# Altium schematic sheet BLE_Module_Sheet.SchDoc
size A4; SheetNumber: 3; SheetTotal: 4
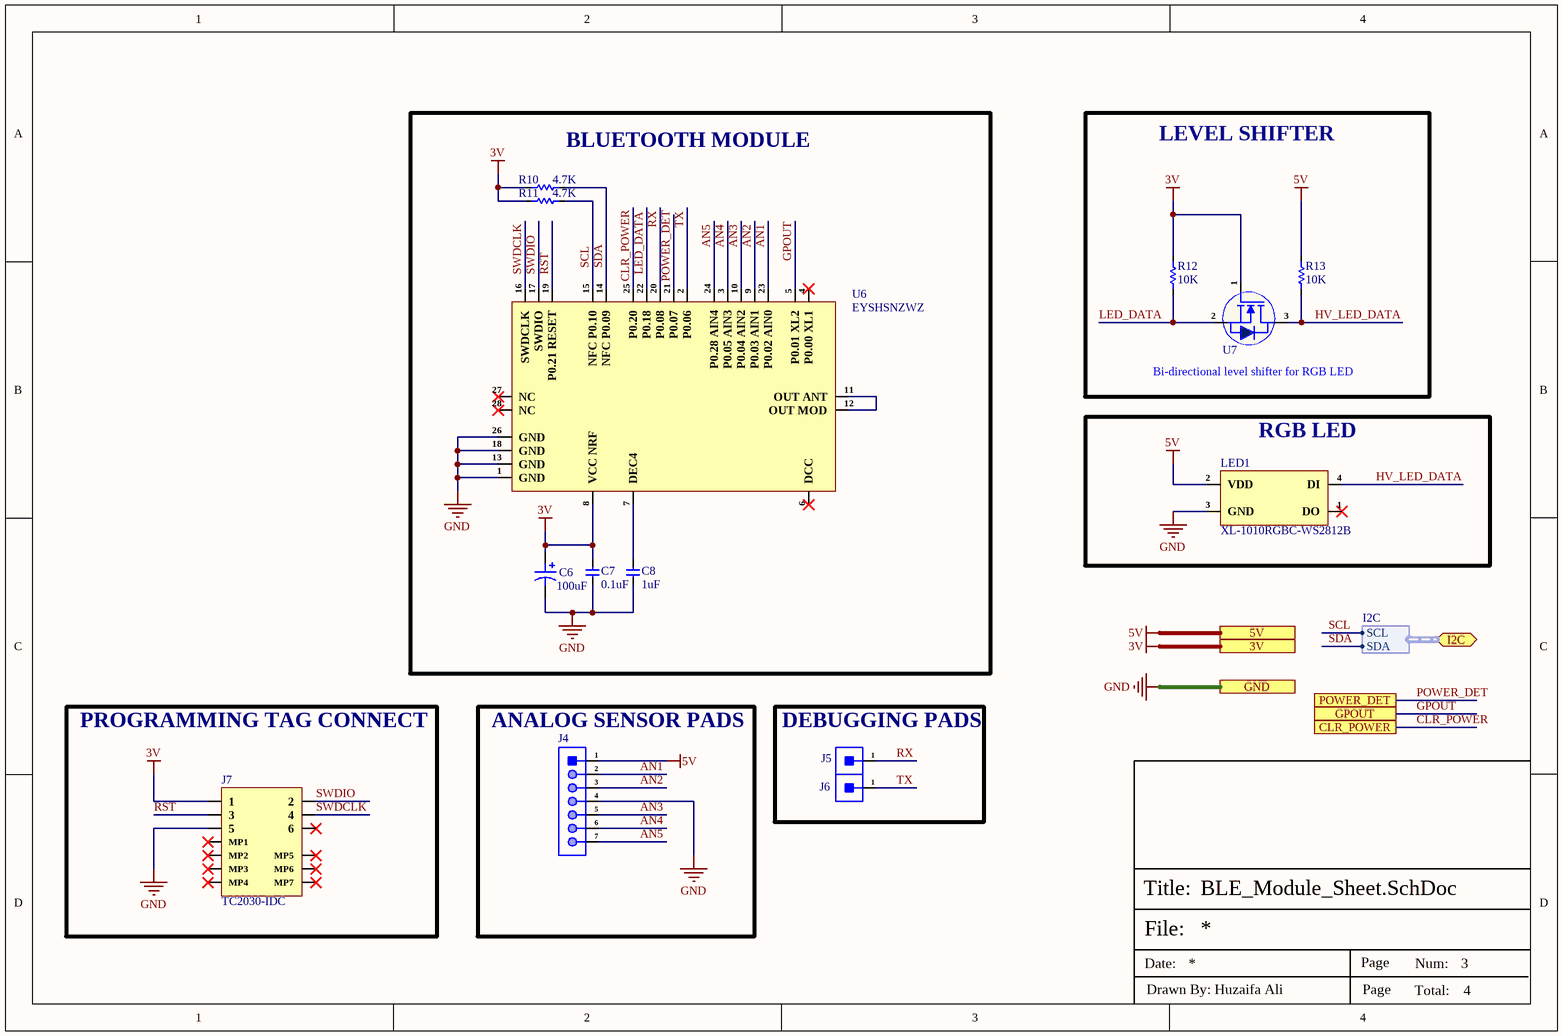
[diagram p0: BLE_Module_Sheet.SchDoc]

## Parts
C6  100uF  [F980J107MMAAXE]
C7  0.1uF  [CAP-0201]
C8  1uF  [CAP-0201]
J4  Sensor Pads 0.5mm Dia  [Sensor-Pads 0.5mm Dia]  (value not drawn)
J5  1 Sensor Pad 0.5mm  [1 Sensor Pad 0.5mm]  (value not drawn)
J6  1 Sensor Pad 0.5mm  [1 Sensor Pad 0.5mm]  (value not drawn)
J7  TC2030-IDC  [TC2030-IDC_]
LED1  XL-1010RGBC-WS2812B  [XL-1010RGBC-WS2812B]
R10  4.7K  [Res-0201]
R11  4.7K  [Res-0201]
R12  10K  [Res-0201]
R13  10K  [Res-0201]
U6  EYSHSNZWZ  [EYSHSNZWZ]
U7  NTNS3193NZT5G  [X-LLGA-3]  (value not drawn)

## Blocks framed on the sheet
BLUETOOTH MODULE: C6-C8 R10 R11 U6
LEVEL SHIFTER: R12 R13 U7
RGB LED: LED1
PROGRAMMING TAG CONNECT: J7
ANALOG SENSOR PADS: J4
DEBUGGING PADS: J5 J6

## Ports
3V, 5V, CLR_POWER, GND, GPOUT, I2C (bidir, harness I2C), POWER_DET

## Harnesses
I2C: SDA, SCL

## Nets
3V: C6.1 C7.2 J7.1 R10.2 R11.2 R12.2 U6.8(VCC_NRF) U7.1(G) ; port 3V
5V: J4.1 LED1.2(VDD) R13.2 ; port 5V
GND: C6.2 C7.1 C8.1 J4.4 J7.5 LED1.3(GND) U6.1(GND) U6.13(GND) U6.18(GND) U6.26(GND) ; port GND
AN1: J4.2 U6.23(P0.02_AIN0)
AN2: J4.3 U6.9(P0.03_AIN1)
AN3: J4.5 U6.10(P0.04_AIN2)
AN4: J4.6 U6.3(P0.05_AIN3)
AN5: J4.7 U6.24(P0.28_AIN4)
CLR_POWER: U6.25(P0.20) ; port CLR_POWER
GPOUT: U6.5(P0.01_XL2) ; port GPOUT
HV_LED_DATA: LED1.4(DI) R13.1 U7.3(D)
LED_DATA: R12.1 U6.22(P0.18) U7.2(S)
POWER_DET: U6.21(P0.07) ; port POWER_DET
RST: J7.3 U6.19(P0.21_RESET)
RX: J5.1 U6.20(P0.08)
SCL: R11.1 U6.15(NFC_P0.10) ; port I2C.SCL
SDA: R10.1 U6.14(NFC_P0.09) ; port I2C.SDA
SWDCLK: J7.4 U6.16(SWDCLK)
SWDIO: J7.2 U6.17(SWDIO)
TX: J6.1 U6.2(P0.06)
NetC8_2: C8.2 U6.7(DEC4)
NetU6_11: U6.11(OUT_ANT) U6.12(OUT_MOD)

Not connected (* = marked no-connect by the designer): J7 6* MP1* MP2* MP3* MP4* MP5* MP6* MP7*; LED1 1(DO)*; U6 4(P0.00_XL1)* 6(DCC)* 27(NC)* 28(NC)*

## Notes on the sheet
- (near U7) Bi-directional level shifter for RGB LED
- File:
- Title:
- Date:
- Page
- Num:
- Total:
- Drawn By: Huzaifa Ali

## Library data of the parts
C6 = F980J107MMAAXE: CAP TANT 100UF 20% 6.3V 0603; Manufacturer: Kyocera AVX; Item Type: Capacitor; Supplier: Digi-Key; Supplier Part Number: 478-9836-1-ND; Manufacturer Part Number: F980J107MMAAXE; RoHS: Yes; Category: Tantalum Capacitors; Stock: 133089; Pricing: 1=0.71, 10=0.505, 50=0.382, 100=0.3327, 500=0.24644, 1000=0.20947 (USD); ComponentLink1URL: http://www.farnell.com/datasheets/2602422.pdf?src-supplier=Farnell; ComponentLink1Description: http://www.farnell.com/datasheets/2602422.pdf?src-supplier=Farnell; ComponentLink2URL: https://datasheet.octopart.com/F980J107MMAAXE-AVX-datasheet-104407997.pdf?src-supplier=Newark; ComponentLink2Description: https://datasheet.octopart.com/F980J107MMAAXE-AVX-datasheet-104407997.pdf?src-supplier=Newark; ComponentLink3URL: https://datasheet.octopart.com/F980J107MMAAXE-KYOCERA-AVX-datasheet-57254939.pdf?src-supplier=Future+Electronics; ComponentLink3Description: https://datasheet.octopart.com/F980J107MMAAXE-KYOCERA-AVX-datasheet-57254939.pdf?src-supplier=Future+Electronics; ComponentLink4URL: http://datasheets.avx.com/F98.pdf?src-supplier=Digi-Key; ComponentLink4Description: http://datasheets.avx.com/F98.pdf?src-supplier=Digi-Key; ComponentLink5URL: http://www.farnell.com/datasheets/2649022.pdf?src-supplier=Newark; ComponentLink5Description: http://www.farnell.com/datasheets/2649022.pdf?src-supplier=Newark; LCSC Part Number: C1955164
C7 = CC0201KRX5R6BB104: CAP CER 0.1UF 10V X5R 0201; Manufacturer: Yageo; Capacitance: 100nF; Tolerance: 10%; Supplier 1: Mouser; Manufacturer Part Number: CC0201KRX5R6BB104; RoHS: Yes; Category: Ceramic Capacitors; Stock 1: 824403; Pricing 1: 1=0.10000, 10=0.02400, 50=0.02400, 100=0.01900, 1000=0.01100, 10000=0.00900 (USD); Mount: Surface Mount; Case/Package: 0201; Case Code (Imperial): 0201; Case Code (Metric): 0603; Weight: 6E-06oz; Min Operating Temperature: -55°C; Max Operating Temperature: 85°C; Dielectric: X5R; Voltage Rating (DC): 10V; Packaging: Tape and Reel; Termination: SMD/SMT; Resistor Type: Ceramic; Voltage Rating: 10V; Series: CC; Construction: Flat; Length: 0.6mm; Width: 0.012inch; Height: 0.3mm; Thickness: 0.013inch; Depth: 0.3mm; Radiation Hardening: No; Lead Free: Lead Free; Halogen Free: Halogen Free; RoHS Compliant: Yes; ComponentLink1URL: https://datasheet.ciiva.com/11587/upy-gphc-x5r-4v-to-50v-12-11587190.pdf?src-supplier=Avnet; ComponentLink1Description: https://datasheet.ciiva.com/11587/upy-gphc-x5r-4v-to-50v-12-11587190.pdf?src-supplier=Avnet; Supplier Part Number 1: 603-CC201KRX5R6BB104; LCSC Part Number: C190183
C8 = CC0201MRX5R7BB105: CAP CER 1UF 16V X5R 0201; Manufacturer: Yageo; Item Type: Capacitor; Supplier: Digi-Key; Supplier Part Number: 13-CC0201MRX5R7BB105TR-ND; Manufacturer Part Number: CC0201MRX5R7BB105; RoHS: Yes; Category: Ceramic Capacitors; LCSC Part Number: C5182464
J4 = Sensor Pads 0.5mm Dia: Wire Connecting Pad; Item Type: SMD Pads; Manufacturer Part Number: Sensor Pads
J5 J6 = 1 Sensor Pad 0.5mm: Wire Connecting Pad 0.5mm; Item Type: SMD Pad; Manufacturer Part Number: 1 Sensor Pad 0.5mm
J7 = TC2030-IDC: CABLE ADAPTER 6 POS; Manufacturer: Tag-Connect; ComponentLink1URL: http://www.tag-connect.com/Materials/TC2030-MCP%20Datasheet.pdf?src-supplier=Digi-Key; ComponentLink1Description: http://www.tag-connect.com/Materials/TC2030-MCP%20Datasheet.pdf?src-supplier=Digi-Key; Supplier 1: Digi-Key; Manufacturer Part Number: TC2030-IDC; Stock 1: 284; Pricing 1: 1=43.71 (USD); Package Quantity: 1; Supplier Part Number 1: TC2030-IDC-ND
LED1 = XL-1010RGBC-WS2812B: Colorless transparence -40℃~+150℃ 正贴 RGB 120° 1010 Light Emitting Diodes (LED) ROHS; Manufacturer: XINGLIGHT; Item Type: RGB LED; Manufacturer Part Number: XL-1010RGBC-WS2812B; Package: 1010; LCSC Part Number: C5349953; ComponentLink1Description: LCSC; ComponentLink1URL: https://www.lcsc.com/product-detail/Light-Emitting-Diodes-LED_XINGLIGHT-XL-1010RGBC-WS2812B_C5349953.html
R10 R11 = RC0201FR-074K7L: RES 4.7K OHM 1% 1/20W 0201; Manufacturer: Yageo; Item Type: Resistor; Supplier: Future Electronics; Supplier Part Number: 7537285; Manufacturer Part Number: RC0201FR-074K7L; RoHS: Yes; Category: Chip SMD Resistors; Stock: 1610000; Pricing: 10000=0.0014, 50000=0.0013, 250000=0.0013, 750000=0.0012, 2000000=0.0011 (USD); ComponentLink1URL: https://datasheet.ciiva.com/2493/pyu-r-int-thick-7-2493811.pdf?src-supplier=Digi-Key; ComponentLink1Description: https://datasheet.ciiva.com/2493/pyu-r-int-thick-7-2493811.pdf?src-supplier=Digi-Key; ComponentLink2URL: https://datasheet.ciiva.com/2493/pyu-r-int-thick-7-2493812.pdf?src-supplier=Digi-Key; ComponentLink2Description: https://datasheet.ciiva.com/2493/pyu-r-int-thick-7-2493812.pdf?src-supplier=Digi-Key; ComponentLink3URL: https://datasheet.ciiva.com/2493/pyu-r-int-thick-7-2493813.pdf?src-supplier=Digi-Key; ComponentLink3Description: https://datasheet.ciiva.com/2493/pyu-r-int-thick-7-2493813.pdf?src-supplier=Digi-Key; ComponentLink4URL: https://datasheet.ciiva.com/8892/pyu-rc0201-51-rohs-l-8-8892942.pdf?src-supplier=Avnet; ComponentLink4Description: https://datasheet.ciiva.com/8892/pyu-rc0201-51-rohs-l-8-8892942.pdf?src-supplier=Avnet; ComponentLink5URL: https://datasheet.ciiva.com/7672/1563626-7672233.pdf?src-supplier=Element14; ComponentLink5Description: https://datasheet.ciiva.com/7672/1563626-7672233.pdf?src-supplier=Element14; LCSC Part Number: C138135
R12 R13 = RC0201JR-0710KL: RES SMD 10K OHM 5% 1/20W 0201; Manufacturer: Yageo; Voltage Rating (DC): 25V; Power Rating: 50mW; Resistance: 10kR; Temperature Coefficient: 200ppm/°C; Case Code (Imperial): 0201; Case Code (Metric): 0603; Case/Package: 0201; Category: Chip SMD Resistors; Contact Plating: Tin,Matte; Depth: 0.3mm; Lead Free: Lead Free; Length: 0.6mm; Manufacturer Part Number: RC0201JR-0710KL; Max Operating Temperature: 125°C; Military Standard: Not; Min Operating Temperature: -55°C; Packaging: Tape and Reel; Radiation Hardening: No; REACH SVHC: Unknown; Resistor Type: Thick Film; Termination: SMD/SMT; Tolerance: 5%; Voltage Rating: 25V; ComponentLink1Description: New link; ComponentLink1URL: *; Supplier 1: Digi-Key; RoHS: Yes; Stock 1: 1488597; Pricing 1: 1=0.10000, 10=0.02600, 100=0.01050, 1000=0.00472, 2500=0.00410, 5000=0.00338 (USD); ComponentLink2URL: https://datasheet.ciiva.com/8891/pyu-rc0201-51-rohs-l-8-8891388.pdf?src-supplier=Avnet; ComponentLink2Description: https://datasheet.ciiva.com/8891/pyu-rc0201-51-rohs-l-8-8891388.pdf?src-supplier=Avnet; ComponentLink3URL: https://datasheet.ciiva.com/7672/1563626-7672253.pdf?src-supplier=Element14; ComponentLink3Description: https://datasheet.ciiva.com/7672/1563626-7672253.pdf?src-supplier=Element14; ComponentLink4URL: https://datasheet.ciiva.com/28405/pyu-rc0201-51-rohs-l-8-28405613.pdf?src-supplier=Avnet+Europe; ComponentLink4Description: https://datasheet.ciiva.com/28405/pyu-rc0201-51-rohs-l-8-28405613.pdf?src-supplier=Avnet+Europe; ComponentLink5URL: https://datasheet.ciiva.com/7672/1563626-7672254.pdf?src-supplier=Element14; ComponentLink5Description: https://datasheet.ciiva.com/7672/1563626-7672254.pdf?src-supplier=Element14; ComponentLink6URL: https://datasheet.ciiva.com/7660/1421516-7660810.pdf?src-supplier=Element14; ComponentLink6Description: https://datasheet.ciiva.com/7660/1421516-7660810.pdf?src-supplier=Element14; ComponentLink7URL: https://datasheet.ciiva.com/16856/pyu-rc0201-51-rohs-l-8-16856011.pdf?src-supplier=Avnet+Europe; ComponentLink7Description: https://datasheet.ciiva.com/16856/pyu-rc0201-51-rohs-l-8-16856011.pdf?src-supplier=Avnet+Europe; ComponentLink8URL: https://datasheet.ciiva.com/46391/1421516-46391291.pdf?src-supplier=Element14; ComponentLink8Description: https://datasheet.ciiva.com/46391/1421516-46391291.pdf?src-supplier=Element14; Supplier Part Number 1: 311-10KNCT-ND; LCSC Part Number: C138117
U6 = EYSHSNZWZ: RF TXRX MODULE BT TRACE ANT SMD; Manufacturer: Taiyo Yuden; Interface: UART; Frequency: 2.4GHz; Data Rate: 1Mbps; Sensitivity: -94dBm; Memory Size: 64KB; Current - Receiving: 11.7mA; Current - Transmitting: 16mA; Supplier: Farnell; Supplier Part Number: 2889504; Manufacturer Part Number: EYSHSNZWZ; RoHS: Yes; Category: RF Receivers, Transceivers; Pricing: 1=14.18, 10=11.82 (GBP); Mounting Technology: Surface Mount; Case/Package: Module; Min Operating Temperature: -40°C; Max Operating Temperature: 85°C; Packaging: Cut Tape; Series: EYSHSN; RoHS Compliant: Yes; ComponentLink1URL: http://www.yuden.co.jp/to/b0060?src-supplier=Digi-Key; ComponentLink1Description: http://www.yuden.co.jp/to/b0060?src-supplier=Digi-Key
U7 = NTNS3193NZT5G: MOSFET N-CH 20V 224MA 3XLLGA; Manufacturer: ON Semiconductor; Item Type: IC; Supplier: Avnet; Supplier Part Number: NTNS3193NZT5G; Manufacturer Part Number: NTNS3193NZT5G; RoHS: Yes; Category: MOSFETs; Stock: 720374; Pricing: 1405=0.26344, 1500=0.25632, 2900=0.2492, 7100=0.24208, 15000=0.23496, 71000=0.22784, 150000=0.22072 (USD); ComponentLink1URL: https://datasheet.ciiva.com/24010/ntns3193nz-d-260351-24010388.pdf?src-supplier=Mouser; ComponentLink1Description: https://datasheet.ciiva.com/24010/ntns3193nz-d-260351-24010388.pdf?src-supplier=Mouser; ComponentLink2URL: https://datasheet.ciiva.com/30022/ntns3193nz-d-30022416.pdf?src-supplier=Avnet; ComponentLink2Description: https://datasheet.ciiva.com/30022/ntns3193nz-d-30022416.pdf?src-supplier=Avnet; LCSC Part Number: C179628